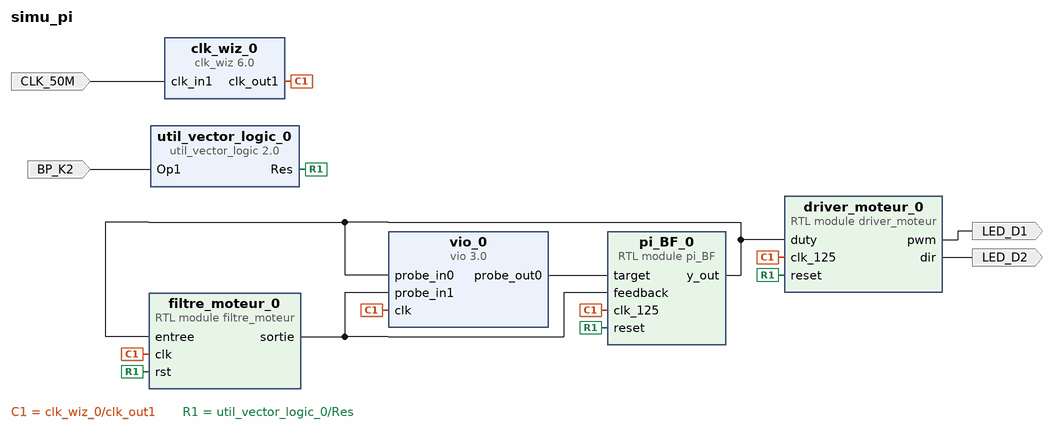
[diagram p0: block diagram of the top level]
# Vivado block design simu_pi, xc7z010clg400-1, Vivado 2020.2
create_bd_design simu_pi

create_bd_port -dir I -type clk CLK_50M
set_property -dict {CONFIG.FREQ_HZ 50000000} [get_bd_ports CLK_50M]
create_bd_port -dir I -type rst BP_K2
create_bd_port -dir O LED_D2
create_bd_port -dir O LED_D1

create_bd_cell -type ip -vlnv xilinx.com:ip:clk_wiz:6.0 clk_wiz_0
set_property -dict [list \
  CONFIG.CLKIN1_JITTER_PS 200.0 \
  CONFIG.CLKOUT1_DRIVES BUFG \
  CONFIG.CLKOUT1_JITTER 154.207 \
  CONFIG.CLKOUT1_PHASE_ERROR 164.985 \
  CONFIG.CLKOUT1_REQUESTED_OUT_FREQ 125 \
  CONFIG.CLKOUT2_DRIVES BUFG \
  CONFIG.CLKOUT3_DRIVES BUFG \
  CONFIG.CLKOUT4_DRIVES BUFG \
  CONFIG.CLKOUT5_DRIVES BUFG \
  CONFIG.CLKOUT6_DRIVES BUFG \
  CONFIG.CLKOUT7_DRIVES BUFG \
  CONFIG.MMCM_CLKFBOUT_MULT_F 20.000 \
  CONFIG.MMCM_CLKIN1_PERIOD 20.000 \
  CONFIG.MMCM_CLKIN2_PERIOD 10.0 \
  CONFIG.MMCM_CLKOUT0_DIVIDE_F 8.000 \
  CONFIG.PRIM_IN_FREQ 50 \
  CONFIG.SECONDARY_SOURCE Single_ended_clock_capable_pin \
  CONFIG.USE_LOCKED false \
  CONFIG.USE_PHASE_ALIGNMENT false \
  CONFIG.USE_RESET false \
] [get_bd_cells clk_wiz_0]
create_bd_cell -type ip -vlnv xilinx.com:ip:vio:3.0 vio_0
set_property -dict [list \
  CONFIG.C_NUM_PROBE_IN 2 \
  CONFIG.C_NUM_PROBE_OUT 1 \
  CONFIG.C_PROBE_OUT0_WIDTH 16 \
  CONFIG.C_PROBE_OUT1_WIDTH 1 \
] [get_bd_cells vio_0]
create_bd_cell -type ip -vlnv xilinx.com:ip:util_vector_logic:2.0 util_vector_logic_0
set_property -dict {CONFIG.C_OPERATION not CONFIG.C_SIZE 1} [get_bd_cells util_vector_logic_0]
create_bd_cell -type module -reference driver_moteur driver_moteur_0
create_bd_cell -type module -reference pi_BF pi_BF_0
set_property -dict {CONFIG.a 1 CONFIG.b 0} [get_bd_cells pi_BF_0]
create_bd_cell -type module -reference filtre_moteur filtre_moteur_0

# ---- connections ----

connect_bd_net -net clk_in1_0_1 [get_bd_ports CLK_50M] [get_bd_pins clk_wiz_0/clk_in1]
connect_bd_net [get_bd_pins clk_wiz_0/clk_out1] \
  [get_bd_pins vio_0/clk] [get_bd_pins driver_moteur_0/clk_125] [get_bd_pins pi_BF_0/clk_125] \
  [get_bd_pins filtre_moteur_0/clk]
connect_bd_net -net reset_0_1 [get_bd_pins util_vector_logic_0/Res] \
  [get_bd_pins driver_moteur_0/reset] [get_bd_pins pi_BF_0/reset] [get_bd_pins filtre_moteur_0/rst]
connect_bd_net [get_bd_pins pi_BF_0/y_out] [get_bd_pins driver_moteur_0/duty] [get_bd_pins filtre_moteur_0/entree] [get_bd_pins vio_0/probe_in0]
connect_bd_net [get_bd_pins driver_moteur_0/dir] [get_bd_ports LED_D2]
connect_bd_net [get_bd_pins driver_moteur_0/pwm] [get_bd_ports LED_D1]
connect_bd_net [get_bd_pins vio_0/probe_out0] [get_bd_pins pi_BF_0/target]
connect_bd_net -net BP_K2_1 [get_bd_ports BP_K2] [get_bd_pins util_vector_logic_0/Op1]
connect_bd_net [get_bd_pins filtre_moteur_0/sortie] [get_bd_pins pi_BF_0/feedback] [get_bd_pins vio_0/probe_in1]

validate_bd_design
save_bd_design
